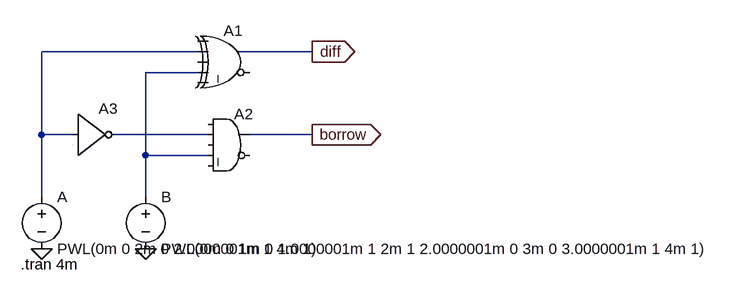
[diagram p0: schematic lab31.asc]
lab31.asc, the LTspice schematic file:
Version 4.1
SHEET 1 880 680
WIRE 16 80 -224 80
WIRE 192 80 80 80
WIRE 16 112 -64 112
WIRE -224 208 -224 80
WIRE -176 208 -224 208
WIRE 32 208 -112 208
WIRE 192 208 96 208
WIRE -64 240 -64 112
WIRE 32 240 -64 240
WIRE -224 304 -224 208
WIRE -64 304 -64 240
FLAG -224 384 0
FLAG 192 208 borrow
IOPIN 192 208 Out
FLAG -64 384 0
FLAG 192 80 diff
IOPIN 192 80 Out
SYMBOL Digital\\xor 64 32 R0
SYMATTR InstName A1
SYMBOL Digital\\and 64 160 R0
SYMATTR InstName A2
SYMBOL voltage -224 288 R0
WINDOW 123 0 0 Left 0
WINDOW 39 0 0 Left 0
SYMATTR InstName A
SYMATTR Value PWL(0m 0 2m 0 2.0000001m 1 4m 1)
SYMBOL voltage -64 288 R0
WINDOW 123 0 0 Left 0
WINDOW 39 0 0 Left 0
SYMATTR InstName B
SYMATTR Value PWL(0m 0 1m 0 1.0000001m 1 2m 1 2.0000001m 0 3m 0 3.0000001m 1 4m 1)
SYMBOL Digital\\inv -176 144 R0
SYMATTR InstName A3
TEXT -256 408 Left 2 !.tran 4m

The netlist it stands for:
* lab31.asc
A1 0 N001 0 N002 0 0 diff 0 XOR
A2 0 N003 0 N002 0 0 borrow 0 AND
V§A N001 0 PWL(0m 0 2m 0 2.0000001m 1 4m 1)
V§B N002 0 PWL(0m 0 1m 0 1.0000001m 1 2m 1 2.0000001m 0 3m 0 3.0000001m 1 4m 1)
A3 N001 0 0 0 0 N003 0 0 BUF
.tran 4m
.backanno
.end